# Altium schematic sheet LFO_AMPS.SchDoc
size A3; SheetNumber: 1; SheetTotal: 8
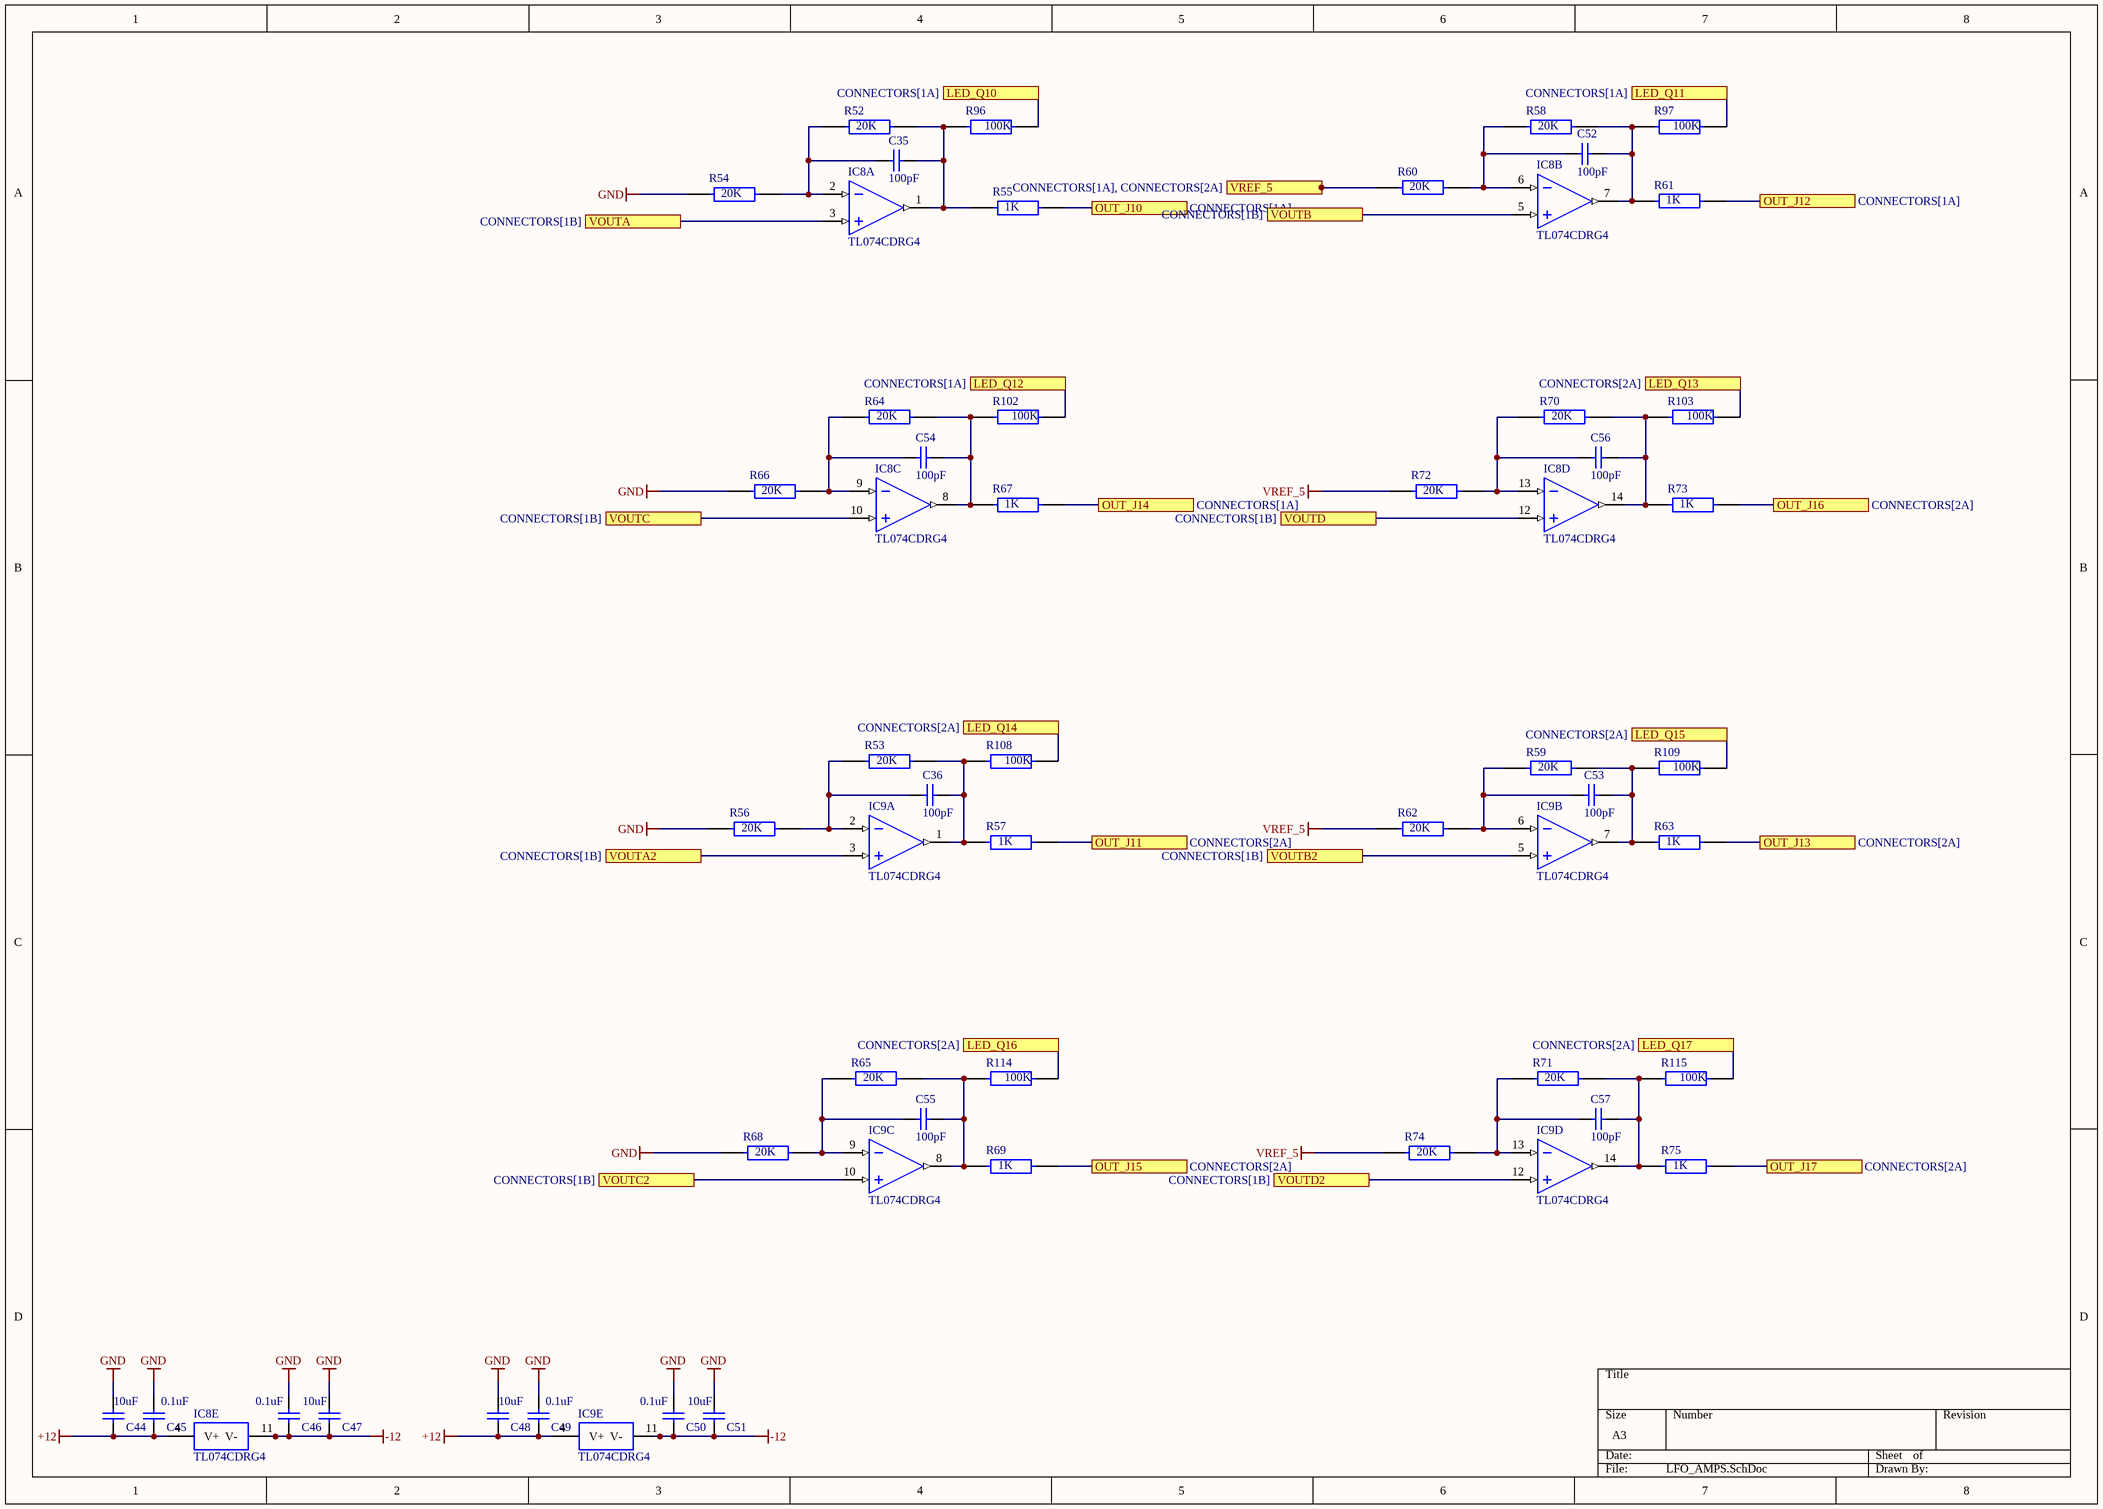
[diagram p0: LFO_AMPS.SchDoc]

## Parts
C35  100pF  [CAPC2013X145X48NL20T23]
C36  100pF  [CAPC2013X145X48NL20T23]
C44  10uF  [CAPC2013X145X48NL20T23]
C45  0.1uF  [CAPC2013X145X48NL20T23]
C46  0.1uF  [CAPC2013X145X48NL20T23]
C47  10uF  [CAPC2013X145X48NL20T23]
C48  10uF  [CAPC2013X145X48NL20T23]
C49  0.1uF  [CAPC2013X145X48NL20T23]
C50  0.1uF  [CAPC2013X145X48NL20T23]
C51  10uF  [CAPC2013X145X48NL20T23]
C52  100pF  [CAPC2013X145X48NL20T23]
C53  100pF  [CAPC2013X145X48NL20T23]
C54  100pF  [CAPC2013X145X48NL20T23]
C55  100pF  [CAPC2013X145X48NL20T23]
C56  100pF  [CAPC2013X145X48NL20T23]
C57  100pF  [CAPC2013X145X48NL20T23]
IC8  TL074CDRG4  [tl074]  (parts A,B,C,D,E of 5)
IC9  TL074CDRG4  [tl074]  (parts A,B,C,D,E of 5)
R52  20K  [FP-RN73R2A-IPC_A]
R53  20K  [FP-RN73R2A-IPC_A]
R54  20K  [FP-RN73R2A-IPC_A]
R55  1K  [FP-RN73R2A-IPC_A]
R56  20K  [FP-RN73R2A-IPC_A]
R57  1K  [FP-RN73R2A-IPC_A]
R58  20K  [FP-RN73R2A-IPC_A]
R59  20K  [FP-RN73R2A-IPC_A]
R60  20K  [FP-RN73R2A-IPC_A]
R61  1K  [FP-RN73R2A-IPC_A]
R62  20K  [FP-RN73R2A-IPC_A]
R63  1K  [FP-RN73R2A-IPC_A]
R64  20K  [FP-RN73R2A-IPC_A]
R65  20K  [FP-RN73R2A-IPC_A]
R66  20K  [FP-RN73R2A-IPC_A]
R67  1K  [FP-RN73R2A-IPC_A]
R68  20K  [FP-RN73R2A-IPC_A]
R69  1K  [FP-RN73R2A-IPC_A]
R70  20K  [FP-RN73R2A-IPC_A]
R71  20K  [FP-RN73R2A-IPC_A]
R72  20K  [FP-RN73R2A-IPC_A]
R73  1K  [FP-RN73R2A-IPC_A]
R74  20K  [FP-RN73R2A-IPC_A]
R75  1K  [FP-RN73R2A-IPC_A]
R96  100K  [FP-RN73R2A-IPC_A]
R97  100K  [FP-RN73R2A-IPC_A]
R102  100K  [FP-RN73R2A-IPC_A]
R103  100K  [FP-RN73R2A-IPC_A]
R108  100K  [FP-RN73R2A-IPC_A]
R109  100K  [FP-RN73R2A-IPC_A]
R114  100K  [FP-RN73R2A-IPC_A]
R115  100K  [FP-RN73R2A-IPC_A]

## Ports
LED_Q10 (see CONNECTORS[1A]), LED_Q11 (see CONNECTORS[1A]), LED_Q12 (see CONNECTORS[1A]), LED_Q13 (see CONNECTORS[2A]), LED_Q14 (see CONNECTORS[2A]), LED_Q15 (see CONNECTORS[2A]), LED_Q16 (see CONNECTORS[2A]), LED_Q17 (see CONNECTORS[2A]), OUT_J10 (see CONNECTORS[1A]), OUT_J11 (see CONNECTORS[2A]), OUT_J12 (see CONNECTORS[1A]), OUT_J13 (see CONNECTORS[2A]), OUT_J14 (see CONNECTORS[1A]), OUT_J15 (see CONNECTORS[2A]), OUT_J16 (see CONNECTORS[2A]), OUT_J17 (see CONNECTORS[2A]), VOUTA2 (see CONNECTORS[1B]), VOUTA (see CONNECTORS[1B]), VOUTB2 (see CONNECTORS[1B]), VOUTB (see CONNECTORS[1B]), VOUTC2 (see CONNECTORS[1B]), VOUTC (see CONNECTORS[1B]), VOUTD2 (see CONNECTORS[1B]), VOUTD (see CONNECTORS[1B]), VREF_5 (see CONNECTORS[1A], CONNECTORS[2A])

## Nets
+12: C44.1 C45.1 C48.1 C49.1 IC8.4(V+) IC9.4(V+)
-12: C46.1 C47.1 C50.1 C51.1 IC8.11(V-) IC9.11(V-)
GND: C44.2 C45.2 C46.2 C47.2 C48.2 C49.2 C50.2 C51.2 R54.1 R56.1 R66.1 R68.1
VREF_5: R60.1 R62.1 R72.1 R74.1 ; port VREF_5
LED_Q10: R96.1 ; port LED_Q10
LED_Q11: R97.1 ; port LED_Q11
LED_Q12: R102.1 ; port LED_Q12
LED_Q13: R103.1 ; port LED_Q13
LED_Q14: R108.1 ; port LED_Q14
LED_Q15: R109.1 ; port LED_Q15
LED_Q16: R114.1 ; port LED_Q16
LED_Q17: R115.1 ; port LED_Q17
OUT_J10: R55.2 ; port OUT_J10
OUT_J11: R57.2 ; port OUT_J11
OUT_J12: R61.2 ; port OUT_J12
OUT_J13: R63.2 ; port OUT_J13
OUT_J14: R67.2 ; port OUT_J14
OUT_J15: R69.2 ; port OUT_J15
OUT_J16: R73.2 ; port OUT_J16
OUT_J17: R75.2 ; port OUT_J17
VOUTA: IC8.3(IN1+) ; port VOUTA
VOUTA2: IC9.3(IN1+) ; port VOUTA2
VOUTB: IC8.5(IN2+) ; port VOUTB
VOUTB2: IC9.5(IN2+) ; port VOUTB2
VOUTC: IC8.10(IN3+) ; port VOUTC
VOUTC2: IC9.10(IN3+) ; port VOUTC2
VOUTD: IC8.12(IN4+) ; port VOUTD
VOUTD2: IC9.12(IN4+) ; port VOUTD2
NetC35_1: C35.1 IC8.1(OUT1) R52.2 R55.1 R96.2
NetC35_2: C35.2 IC8.2(IN1-) R52.1 R54.2
NetC36_1: C36.1 IC9.1(OUT1) R53.2 R57.1 R108.2
NetC36_2: C36.2 IC9.2(IN1-) R53.1 R56.2
NetC52_1: C52.1 IC8.7(OUT2) R58.2 R61.1 R97.2
NetC52_2: C52.2 IC8.6(IN2-) R58.1 R60.2
NetC53_1: C53.1 IC9.7(OUT2) R59.2 R63.1 R109.2
NetC53_2: C53.2 IC9.6(IN2-) R59.1 R62.2
NetC54_1: C54.1 IC8.8(OUT3) R64.2 R67.1 R102.2
NetC54_2: C54.2 IC8.9(IN3-) R64.1 R66.2
NetC55_1: C55.1 IC9.8(OUT3) R65.2 R69.1 R114.2
NetC55_2: C55.2 IC9.9(IN3-) R65.1 R68.2
NetC56_1: C56.1 IC8.14(OUT4) R70.2 R73.1 R103.2
NetC56_2: C56.2 IC8.13(IN4-) R70.1 R72.2
NetC57_1: C57.1 IC9.14(OUT4) R71.2 R75.1 R115.2
NetC57_2: C57.2 IC9.13(IN4-) R71.1 R74.2

## Library data of the parts
C35 C36 C44-C57 = CAP: Manufacturer: Vitramon; Part Number: VJ0805Y682KXAMT
IC8 IC9 = tl074: Quad Low-Noise JFET-Input General-Purpose Operational Amplifier, 7 to 36 V, 0 to 70 degC, 14-pin SOIC (D14), Green (RoHS & no Sb/Br); Manufacturer: Texas Instruments; GBW(Typ)(MHz): 3; Sub Family: General Purpose Amplifier, High Supply Voltage Amplifier (>=30V); Vn at 1kHz(Typ)(nV/rtHz): 18; Rating: Military; Total Supply Voltage(Min)(+5V is 5, +/-5V is 10): 7; IIB(Max)(pA): 200; CMRR(Min)(dB): 70; Number of Channels: 4; Vio (25C)(Max)(mV): 10; Slew Rate(Typ)(V/us): 13; Iq per channel(Max)(mA): 2.5; Total Supply Voltage(Max)(+5V is 5, +/-5V is 10): 36; ComponentLink2URL: http://www.ti.com/lit/ds/symlink/tl074.pdf; ComponentLink3Description: Package Specification; PackageReference: D0014A; ComponentLink1URL: http://www.ti.com/; PartNumber: TL074CDRG4; PackageVersion: 4040047-5/M, 06/2011; Eco-Plan: Green (RoHS & no Sb/Br); PackageDescription: 14-Pin Plastic Small Outline, Body 8.65 x 3.90 mm, Pitch 1.27 mm; Mounting Technology: Surface Mount; ComponentLink1Description: Manufacturer URL; Offset Drift(Typ)(uV/C): 18; ComponentLink3URL: http://www.ti.com/lit/ml/mpds177g/mpds177g.pdf; ComponentLink2Description: Datasheet; DatasheetVersion: SLOS080J; Code_JEDEC: MS-012
R52-R75 R96 R97 R102 R103 R108 R109 R114 R115 = Resistor: RES 10K OHM 0.1% 1/8W 0805